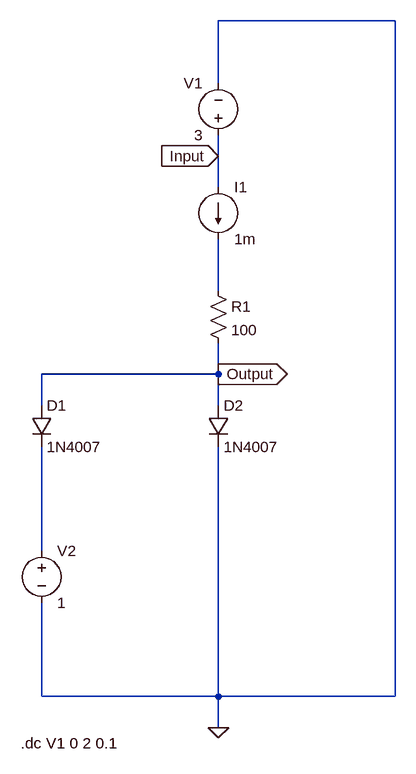
[diagram p0: schematic part2-2.1.asc]
part2-2.1.asc, the LTspice schematic file:
Version 4.1
SHEET 1 880 920
WIRE 496 -208 224 -208
WIRE 224 -112 224 -208
WIRE 224 0 224 -32
WIRE 224 48 224 0
WIRE 224 208 224 128
WIRE 224 336 224 288
WIRE 224 336 -48 336
WIRE -48 384 -48 336
WIRE 224 384 224 336
WIRE -48 608 -48 448
WIRE -48 832 -48 688
WIRE 224 832 224 448
WIRE 224 832 -48 832
WIRE 496 832 496 -208
WIRE 496 832 224 832
WIRE 224 880 224 832
FLAG 224 880 0
FLAG 224 336 Output
IOPIN 224 336 Out
FLAG 224 0 Input
IOPIN 224 0 In
SYMBOL current 224 48 R0
WINDOW 123 0 0 Left 0
WINDOW 39 0 0 Left 0
SYMATTR InstName I1
SYMATTR Value 1m
SYMBOL voltage 224 -16 R180
WINDOW 0 24 96 Left 2
WINDOW 3 24 16 Left 2
WINDOW 123 0 0 Left 0
WINDOW 39 0 0 Left 0
SYMATTR InstName V1
SYMATTR Value 3
SYMBOL res 208 192 R0
SYMATTR InstName R1
SYMATTR Value 100
SYMBOL diode -64 384 R0
SYMATTR InstName D1
SYMATTR Value 1N4007
SYMBOL diode 208 384 R0
SYMATTR InstName D2
SYMATTR Value 1N4007
SYMBOL voltage -48 592 R0
WINDOW 123 0 0 Left 0
WINDOW 39 0 0 Left 0
SYMATTR InstName V2
SYMATTR Value 1
TEXT -80 904 Left 2 !.dc V1 0 2 0.1

The netlist it stands for:
* part2-2.1.asc
I1 Input N001 1m
V1 Input 0 3
R1 N001 Output 100
D1 Output N002 1N4007
D2 Output 0 1N4007
V2 N002 0 1
.model D D
.lib standard.dio
.dc V1 0 2 0.1
.backanno
.end

* Results of the author's LTspice run, read from the files saved beside the schematic
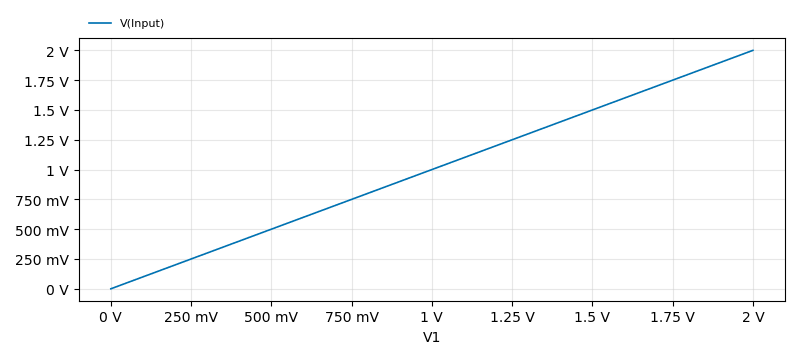
[diagram p1: DC transfer characteristic of part2-2.1.asc, plotted from the saved traces]
* DC transfer characteristic, 1 run:
*   V(Input): 0 V at V1=0 V, 2 V at V1=2 V, min 0 V, max 2 V